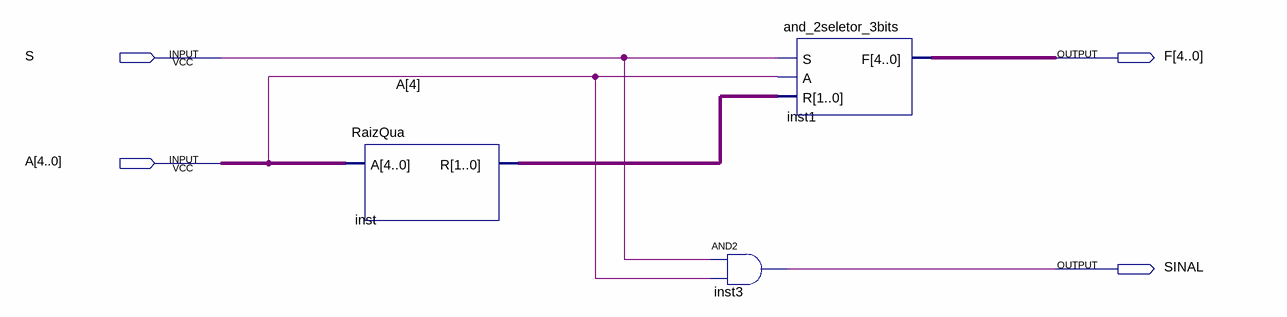
[diagram p0: schematic sheet]
// Quartus schematic BLOCO_raiz.bdf as structural Verilog: 3 symbols, 4 pins
module BLOCO_raiz (
  input  S,
  input  [4:0] A,
  output [4:0] F,
  output SINAL
);

  wire [1:0] inst_r;

  RaizQua inst (.A(A), .R(inst_r));
  and inst3 (SINAL, S, A[4]);
  and_2seletor_3bits inst1 (.S(S), .A(A[4]), .R(inst_r), .F(F));
endmodule
